# Altium schematic sheet band_pass_diff_filter.SchDoc: Band-pass differential filter
size A4; DocumentNumber: ADC-SCH-06; SheetNumber: 6; SheetTotal: 20
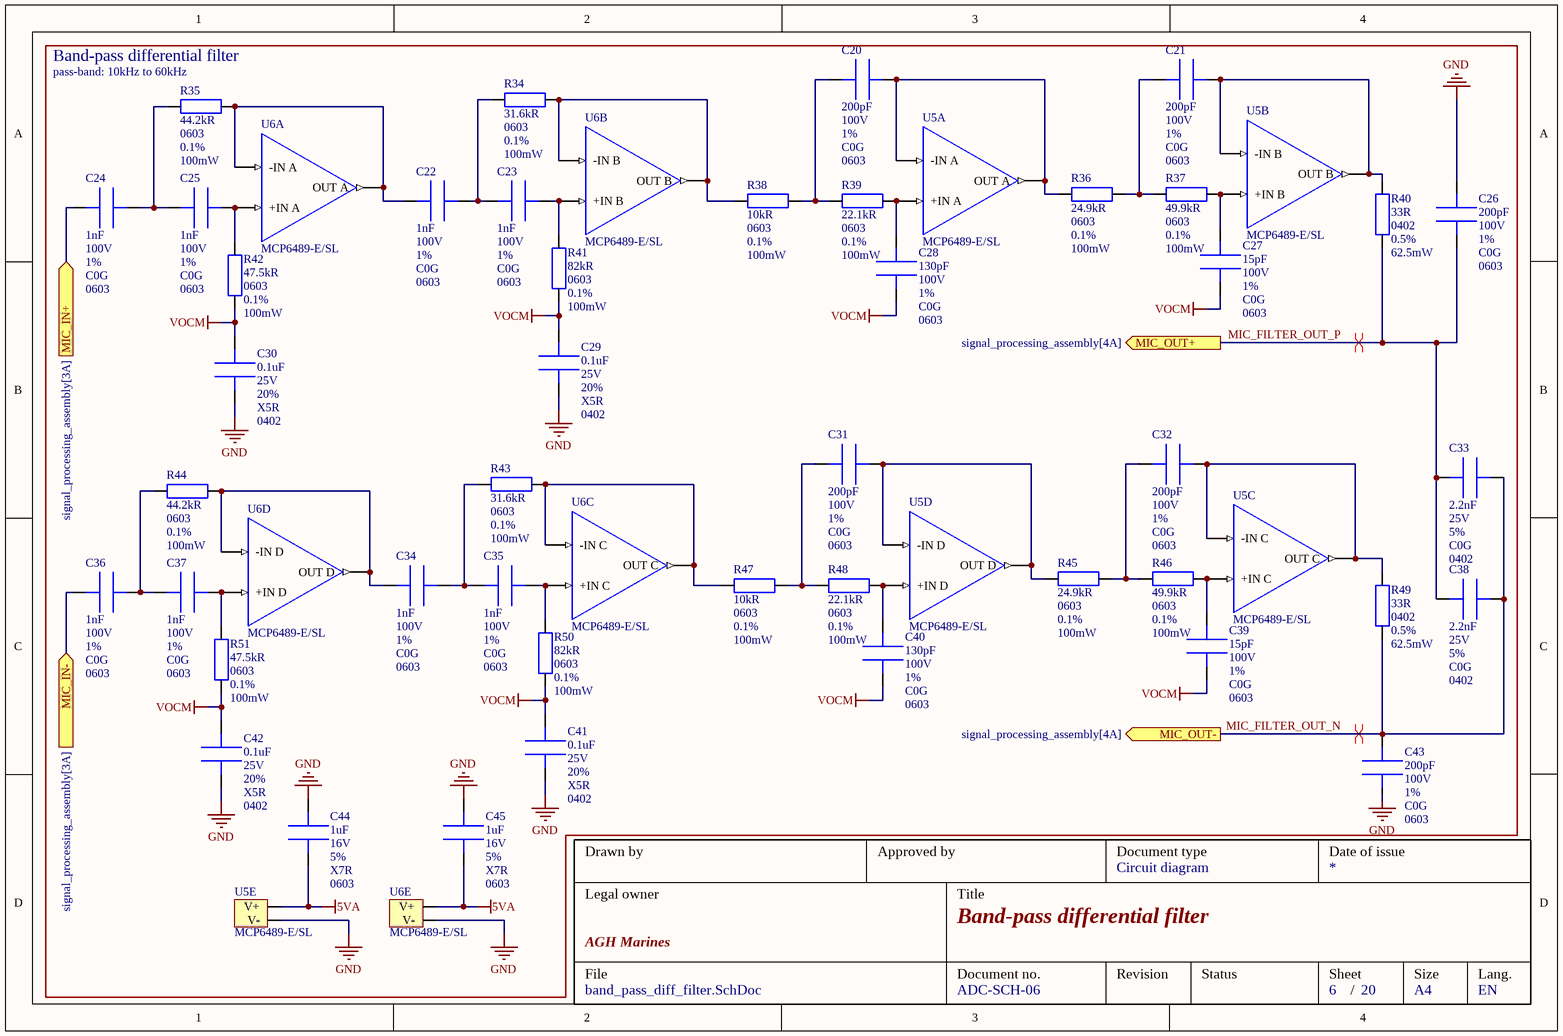
[diagram p0: band_pass_diff_filter.SchDoc]

## Parts
C20  value 200pF  Voltage: 100V  Tolerance: 1%  Dielectric: C0G  Package: 0603  [CAPC_0603]  (hidden comment: C0402C221J3GACTU)
C21  value 200pF  Voltage: 100V  Tolerance: 1%  Dielectric: C0G  Package: 0603  [CAPC_0603]  (hidden comment: C0402C221J3GACTU)
C22  value 1nF  Voltage: 100V  Tolerance: 1%  Dielectric: C0G  Package: 0603  [CAPC_0603]  (hidden comment: C0603C153G4GACTU)
C23  value 1nF  Voltage: 100V  Tolerance: 1%  Dielectric: C0G  Package: 0603  [CAPC_0603]  (hidden comment: C0603C153G4GACTU)
C24  value 1nF  Voltage: 100V  Tolerance: 1%  Dielectric: C0G  Package: 0603  [CAPC_0603]  (hidden comment: C0603C153G4GACTU)
C25  value 1nF  Voltage: 100V  Tolerance: 1%  Dielectric: C0G  Package: 0603  [CAPC_0603]  (hidden comment: C0603C153G4GACTU)
C26  value 200pF  Voltage: 100V  Tolerance: 1%  Dielectric: C0G  Package: 0603  [CAPC_0603]  (hidden comment: C0402C221J3GACTU)
C27  value 15pF  Voltage: 100V  Tolerance: 1%  Dielectric: C0G  Package: 0603  [CAPC_0603]  (hidden comment: KGM15ACG1H150FT)
C28  value 130pF  Voltage: 100V  Tolerance: 1%  Dielectric: C0G  Package: 0603  [CAPC_0603]  (hidden comment: C0603C131F5GACTU)
C29  value 0.1uF  Voltage: 25V  Tolerance: 20%  Dielectric: X5R  Package: 0402  [CAPC_0402]  (hidden comment: MSAST105SB5104MFNA01)
C30  value 0.1uF  Voltage: 25V  Tolerance: 20%  Dielectric: X5R  Package: 0402  [CAPC_0402]  (hidden comment: MSAST105SB5104MFNA01)
C31  value 200pF  Voltage: 100V  Tolerance: 1%  Dielectric: C0G  Package: 0603  [CAPC_0603]  (hidden comment: C0402C221J3GACTU)
C32  value 200pF  Voltage: 100V  Tolerance: 1%  Dielectric: C0G  Package: 0603  [CAPC_0603]  (hidden comment: C0402C221J3GACTU)
C33  value 2.2nF  Voltage: 25V  Tolerance: 5%  Dielectric: C0G  Package: 0402  [CAPC_0402]  (hidden comment: C0402C222J3GACTU)
C34  value 1nF  Voltage: 100V  Tolerance: 1%  Dielectric: C0G  Package: 0603  [CAPC_0603]  (hidden comment: C0603C153G4GACTU)
C35  value 1nF  Voltage: 100V  Tolerance: 1%  Dielectric: C0G  Package: 0603  [CAPC_0603]  (hidden comment: C0603C153G4GACTU)
C36  value 1nF  Voltage: 100V  Tolerance: 1%  Dielectric: C0G  Package: 0603  [CAPC_0603]  (hidden comment: C0603C153G4GACTU)
C37  value 1nF  Voltage: 100V  Tolerance: 1%  Dielectric: C0G  Package: 0603  [CAPC_0603]  (hidden comment: C0603C153G4GACTU)
C38  value 2.2nF  Voltage: 25V  Tolerance: 5%  Dielectric: C0G  Package: 0402  [CAPC_0402]  (hidden comment: C0402C222J3GACTU)
C39  value 15pF  Voltage: 100V  Tolerance: 1%  Dielectric: C0G  Package: 0603  [CAPC_0603]  (hidden comment: KGM15ACG1H150FT)
C40  value 130pF  Voltage: 100V  Tolerance: 1%  Dielectric: C0G  Package: 0603  [CAPC_0603]  (hidden comment: C0603C131F5GACTU)
C41  value 0.1uF  Voltage: 25V  Tolerance: 20%  Dielectric: X5R  Package: 0402  [CAPC_0402]  (hidden comment: MSAST105SB5104MFNA01)
C42  value 0.1uF  Voltage: 25V  Tolerance: 20%  Dielectric: X5R  Package: 0402  [CAPC_0402]  (hidden comment: MSAST105SB5104MFNA01)
C43  value 200pF  Voltage: 100V  Tolerance: 1%  Dielectric: C0G  Package: 0603  [CAPC_0603]  (hidden comment: C0402C221J3GACTU)
C44  value 1uF  Voltage: 16V  Tolerance: 5%  Dielectric: X7R  Package: 0603  [CAPC_0603]  (hidden comment: CC0603JRX7R7BB105)
C45  value 1uF  Voltage: 16V  Tolerance: 5%  Dielectric: X7R  Package: 0603  [CAPC_0603]  (hidden comment: CC0603JRX7R7BB105)
R34  value 31.6kR  Package: 0603  Tolerance: 0.1%  Power: 100mW  [RESC_0603]  (hidden comment: RT0603BRD0731K6L)
R35  value 44.2kR  Package: 0603  Tolerance: 0.1%  Power: 100mW  [RESC_0603]  (hidden comment: RP0603BRD073K65L)
R36  value 24.9kR  Package: 0603  Tolerance: 0.1%  Power: 100mW  [RESC_0603]  (hidden comment: ERA-3AEB2492V)
R37  value 49.9kR  Package: 0603  Tolerance: 0.1%  Power: 100mW  [RESC_0603]  (hidden comment: RG1608P-4992-B-T5)
R38  value 10kR  Package: 0603  Tolerance: 0.1%  Power: 100mW  [RESC_0603]  (hidden comment: RT0603BRD0710KL)
R39  value 22.1kR  Package: 0603  Tolerance: 0.1%  Power: 100mW  [RESC_0603]  (hidden comment: RT0603BRD0722K1L)
R40  value 33R  Package: 0402  Tolerance: 0.5%  Power: 62.5mW  [RESC_0402]  (hidden comment: RG1005R-330-D-T10)
R41  value 82kR  Package: 0603  Tolerance: 0.1%  Power: 100mW  [RESC_0603]  (hidden comment: RT0603BRD0782KL)
R42  value 47.5kR  Package: 0603  Tolerance: 0.1%  Power: 100mW  [RESC_0603]  (hidden comment: ERA-3AEB4752V)
R43  value 31.6kR  Package: 0603  Tolerance: 0.1%  Power: 100mW  [RESC_0603]  (hidden comment: RT0603BRD0731K6L)
R44  value 44.2kR  Package: 0603  Tolerance: 0.1%  Power: 100mW  [RESC_0603]  (hidden comment: RP0603BRD073K65L)
R45  value 24.9kR  Package: 0603  Tolerance: 0.1%  Power: 100mW  [RESC_0603]  (hidden comment: ERA-3AEB2492V)
R46  value 49.9kR  Package: 0603  Tolerance: 0.1%  Power: 100mW  [RESC_0603]  (hidden comment: RG1608P-4992-B-T5)
R47  value 10kR  Package: 0603  Tolerance: 0.1%  Power: 100mW  [RESC_0603]  (hidden comment: RT0603BRD0710KL)
R48  value 22.1kR  Package: 0603  Tolerance: 0.1%  Power: 100mW  [RESC_0603]  (hidden comment: RT0603BRD0722K1L)
R49  value 33R  Package: 0402  Tolerance: 0.5%  Power: 62.5mW  [RESC_0402]  (hidden comment: RG1005R-330-D-T10)
R50  value 82kR  Package: 0603  Tolerance: 0.1%  Power: 100mW  [RESC_0603]  (hidden comment: RT0603BRD0782KL)
R51  value 47.5kR  Package: 0603  Tolerance: 0.1%  Power: 100mW  [RESC_0603]  (hidden comment: ERA-3AEB4752V)
U5  MCP6489-E/SL  [IC_SOIC14]  (parts A,B,C,D,E of 5)
U6  MCP6489-E/SL  [IC_SOIC14]  (parts A,B,C,D,E of 5)

## Ports
MIC_IN+ (in, see signal_processing_assembly[3A]), MIC_IN- (in, see signal_processing_assembly[3A]), MIC_OUT+ (out, see signal_processing_assembly[4A]), MIC_OUT- (out, see signal_processing_assembly[4A])

## Nets
5VA: C44.2 C45.2 U5.4(V+) U6.4(V+)
GND: C26.1 C29.2 C30.2 C41.2 C42.2 C43.2 C44.1 C45.1 U5.11(V-) U6.11(V-)
VOCM: C27.2 C28.2 C29.1 C30.1 C39.2 C40.2 C41.1 C42.1 R41.2 R42.2 R50.2 R51.2
MIC_FILTER_OUT_N: C33.1 C38.1 C43.1 R49.2 ; port MIC_OUT-
MIC_FILTER_OUT_P: C26.2 C33.2 C38.2 R40.2 ; port MIC_OUT+
MIC_IN+: C24.2 ; port MIC_IN+
MIC_IN-: C36.2 ; port MIC_IN-
NetC20_1: C20.1 R38.1 R39.2
NetC20_2: C20.2 R36.2 U5.1(OUT_A) U5.2(-IN_A)
NetC21_1: C21.1 R36.1 R37.2
NetC21_2: C21.2 R40.1 U5.6(-IN_B) U5.7(OUT_B)
NetC22_1: C22.1 C23.2 R34.2
NetC22_2: C22.2 R35.1 U6.1(OUT_A) U6.2(-IN_A)
NetC23_1: C23.1 R41.1 U6.5(+IN_B)
NetC24_1: C24.1 C25.2 R35.2
NetC25_1: C25.1 R42.1 U6.3(+IN_A)
NetC27_1: C27.1 R37.1 U5.5(+IN_B)
NetC28_1: C28.1 R39.1 U5.3(+IN_A)
NetC31_1: C31.1 R47.1 R48.2
NetC31_2: C31.2 R45.2 U5.13(-IN_D) U5.14(OUT_D)
NetC32_1: C32.1 R45.1 R46.2
NetC32_2: C32.2 R49.1 U5.8(OUT_C) U5.9(-IN_C)
NetC34_1: C34.1 C35.2 R43.2
NetC34_2: C34.2 R44.1 U6.13(-IN_D) U6.14(OUT_D)
NetC35_1: C35.1 R50.1 U6.10(+IN_C)
NetC36_1: C36.1 C37.2 R44.2
NetC37_1: C37.1 R51.1 U6.12(+IN_D)
NetC39_1: C39.1 R46.1 U5.10(+IN_C)
NetC40_1: C40.1 R48.1 U5.12(+IN_D)
NetR34_1: R34.1 R38.2 U6.6(-IN_B) U6.7(OUT_B)
NetR43_1: R43.1 R47.2 U6.8(OUT_C) U6.9(-IN_C)

## Layout directives
differential pair: MIC_FILTER_OUT_N, MIC_FILTER_OUT_P

## Notes on the sheet
- (near R35) Band-pass differential filter
- (near R35) pass-band: 10kHz to 60kHz
- Drawn by
- Approved by
- Document type
- Date of issue
- Legal owner
- Title
- Circuit diagram
- File
- AGH Marines
- Document no.
- Revision
- Status
- Sheet
- Size
- Lang.
- /
- A4
- EN

## Library data of the parts
C20 C21 C26 C31 C32 C43 = GCM1885C2A201FA16J: Multilayer Ceramic Capacitors MLCC - SMD/SMT 200 pF 100 VDC 1% 0603 C0G (NP0) AEC-Q200; Manufacturer: Murata Electronics; Supplier 1: Mouser; Supplier Part Number 1: 81-GCM1885C2A201FA6J
C22-C25 C34-C37 = GCM1885C2A102FA16D: Multilayer Ceramic Capacitors MLCC - SMD/SMT 1000 pF 100 VDC 1% 0603 C0G (NP0) AEC-Q200; Manufacturer: Murata Electronics; Supplier 1: Mouser; Supplier Part Number 1: 81-GCM1885C2A102FA6D
C27 C39 = CC0603FRNPO0BN150: Multilayer Ceramic Capacitors MLCC - SMD/SMT 100V 15pF C0G 0603 1%; Manufacturer: YAGEO; Supplier 1: Mouser; Supplier Part Number 1: 603-CC603FRNPO0BN150
C28 C40 = GCM1885C2A131FA16J: Multilayer Ceramic Capacitors MLCC - SMD/SMT 130 pF 100 VDC 1% 0603 C0G (NP0) AEC-Q200; Manufacturer: Murata Electronics; Supplier 1: Mouser; Supplier Part Number 1: 81-GCM1885C2A131FA6J
C29 C30 C41 C42 = MSAST105SB5104MFNA01: Multilayer Ceramic Capacitors MLCC - SMD/SMT 25V 0.1uF X5R 0402 20%; Manufacturer: TAIYO YUDEN; Supplier 1: Mouser; Supplier Part Number 1: 963-MSAST105SB5104MF
C33 C38 = C0402C222J3GACTU: Multilayer Ceramic Capacitors MLCC - SMD/SMT 25V 2200pF C0G 0402 5%; Manufacturer: KEMET; Supplier 1: Mouser; Supplier Part Number 1: 80-C0402C222J3GACTU
C44 C45 = CC0603JRX7R7BB105: Multilayer Ceramic Capacitors MLCC - SMD/SMT 16V 1uF X7R 0603 5% HI CV; Manufacturer: YAGEO; Supplier 1: Mouser; Supplier Part Number 1: 603-CC0603JRX77BB105
R34 R43 = RT0603BRD0731K6L: Thin Film Resistors 1/10W 31.6K ohm .1% 25ppm; Manufacturer: YAGEO; Supplier 1: Mouser; Supplier Part Number 1: 603-RT0603BRD0731K6L
R35 R44 = RT0603BRD0744K2L: Thin Film Resistors 1/10W 44.2K ohm .1% 25ppm; Manufacturer: YAGEO; Supplier 1: Mouser; Supplier Part Number 1: 603-RT0603BRD0744K2L
R36 R45 = ERA-3AEB2492V: Thin Film Resistors 0603 24.9Kohm 0.1% 25ppm; Manufacturer: Panasonic; Supplier 1: Mouser; Supplier Part Number 1: 667-ERA-3AEB2492V
R37 R46 = RG1608P-4992-B-T5: Thin Film Resistors 1/10W 49.9K Ohm 0.1% 0603 25ppm; Manufacturer: Susumu; Supplier 1: Mouser; Supplier Part Number 1: 754-RG1608P-4992-BT5
R38 R47 = RT0603BRD0710KL: Thin Film Resistors 10K ohm 0.1% 1/10W; Manufacturer: YAGEO; Supplier 1: Mouser; Supplier Part Number 1: 603-RT0603BRD0710KL
R39 R48 = RT0603BRD0722K1L: Thin Film Resistors 1/10W 22.1K ohm .1% 25ppm; Manufacturer: YAGEO; Supplier 1: Mouser; Supplier Part Number 1: 603-RT0603BRD0722K1L
R40 R49 = RG1005R-330-D-T10: Thin Film Resistors - SMD 1/16W 33 Ohms 0.5% 0402 100ppm; Manufacturer: Susumu; Supplier 1: Mouser; Supplier Part Number 1: 754-RG1005R-330DT10
R41 R50 = RT0603BRD0782KL: Thin Film Resistors 1/10W 82K ohm .1% 25ppm; Manufacturer: YAGEO; Supplier 1: Mouser; Supplier Part Number 1: 603-RT0603BRD0782KL
R42 R51 = ERA-3AEB4752V: Thin Film Resistors 0603 47.5Kohm 0.1% 25ppm; Manufacturer: Panasonic; Supplier 1: Mouser; Supplier Part Number 1: 667-ERA-3AEB4752V
U5 U6 = MCP6489-E/SL: Manufacturer: Microchip Technology; Package: SOIC-14; Supplier 1: Mouser; Supplier Part Number 1: 494-MCP6489-E/SL